# Altium schematic sheet Power.SchDoc
size A; SheetNumber: 3; SheetTotal: 4
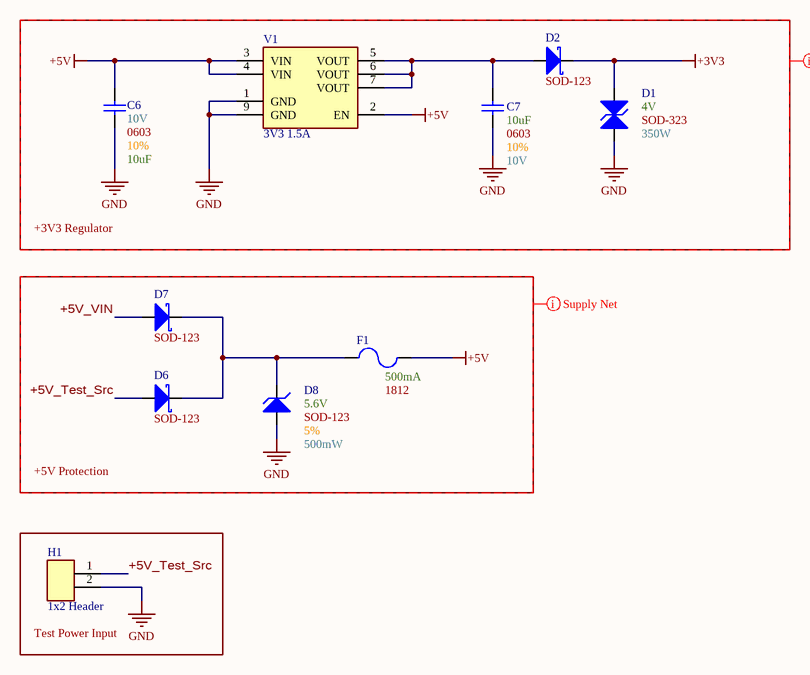
[diagram p0: Power.SchDoc]

## Parts
C6  Max Voltage: 10V  Size Package: 0603  Tolerance: 10%  Capacitance: 10uF  [[Cap] SMD 0603]  (hidden comment: [Cap] 0603 10uF 10% 10V)
C7  Max Voltage: 10V  Size Package: 0603  Tolerance: 10%  Capacitance: 10uF  [[Cap] SMD 0603]  (hidden comment: [Cap] 0603 10uF 10% 10V)
D1  Wattage: 350W  Optimal Zener Voltage: 4V  [[Diode] SOD-323]  (hidden comment: SOD-323)
D2  Footprint: SOD-123  [[Diode] SMD SOD-123]  (hidden comment: SOD123)
D6  Footprint: SOD-123  [[Diode] SMD SOD-123]  (hidden comment: SOD123)
D7  Footprint: SOD-123  [[Diode] SMD SOD-123]  (hidden comment: SOD123)
D8  Tolerance: 5%  Wattage: 500mW  Optimal Zener Voltage: 5.6V  [[Diode] SMD SOD-123]  (hidden comment: SOD-123)
F1  Size Package: 1812  Trip Current: 500mA  [[PTC] SMD 1812]  (hidden comment: [PTC] SMD 1812 500mA)
H1  1x2 Header  [[Header] 1x2 Male]
V1  3V3 1.5A  [[Linear] 3V3 1.5A]

## Blocks framed on the sheet
+3V3 Regulator: C6 C7 D1 D2 V1
+5V Protection: D6-D8 F1
Test Power Input: H1

## Nets
+3V3: D1.1(K) D2.1(K)
+5V: C6.2 F1.2 V1.2(EN) V1.3(VIN) V1.4(VIN)
GND: C6.1 C7.1 D1.2(A) D8.2(A) H1.2 V1.1(GND) V1.9(GND)
+5V_Test_Src: D6.2(A) H1.1
+5V_VIN: D7.2(A)
NetC7_2: C7.2 D2.2(A) V1.5(VOUT) V1.6(VOUT) V1.7(VOUT)
NetD6_1: D6.1(K) D7.1(K) D8.1(K) F1.1

## Layout directives
net class Supply_Nets: +3V3, +5V, +5V_Test_Src, +5V_VIN, GND

## Library data of the parts
C6 C7 = [Cap] 0603 10uF 10% 10V: CL10A106KP8NNNC; Supplier 1: DigiKey; Supplier Part Number 1: 1276-1192-6-ND
D1 = [TVS] 3.3Vnom 19Vclamp_max: CDSOD323-T03C; Supplier 1: DigiKey; Footprint: SOD-323; Supplier Part Number 1: CDSOD323-T03CDKR-ND
D2 D6 D7 = [Schottky] SMD 40V 1A: B5819W-TP; Supplier 1: DigiKey; Supplier Part Number 1: B5819W-TPMSCT-ND
D8 = [Zener] SMD 5.6V 1/2W 5%: CMHZ5232B TR PBFREE; Supplier 1: DigiKey; Footprint: SOD-123; Supplier Part Number 1: 1514-CMHZ5232BTRPBFREEDKR-ND
F1 = [PTC] SMD 1812 500mA: MF-MSMF050-2; Supplier 1: DigiKey; Supplier Part Number 1: MF-MSMF050-2DKR-ND
H1 = [Header] 1x2 Male: 2.54mm pitch
V1 = [Linear] 3V3 1.5A: AP7362A-33SP-13; Supplier 1: DigiKey; Supplier Part Number 1: AP7362A-33SP-13DICT-ND